# Altium schematic sheet 03_ESP32_CORE.SchDoc
size A3
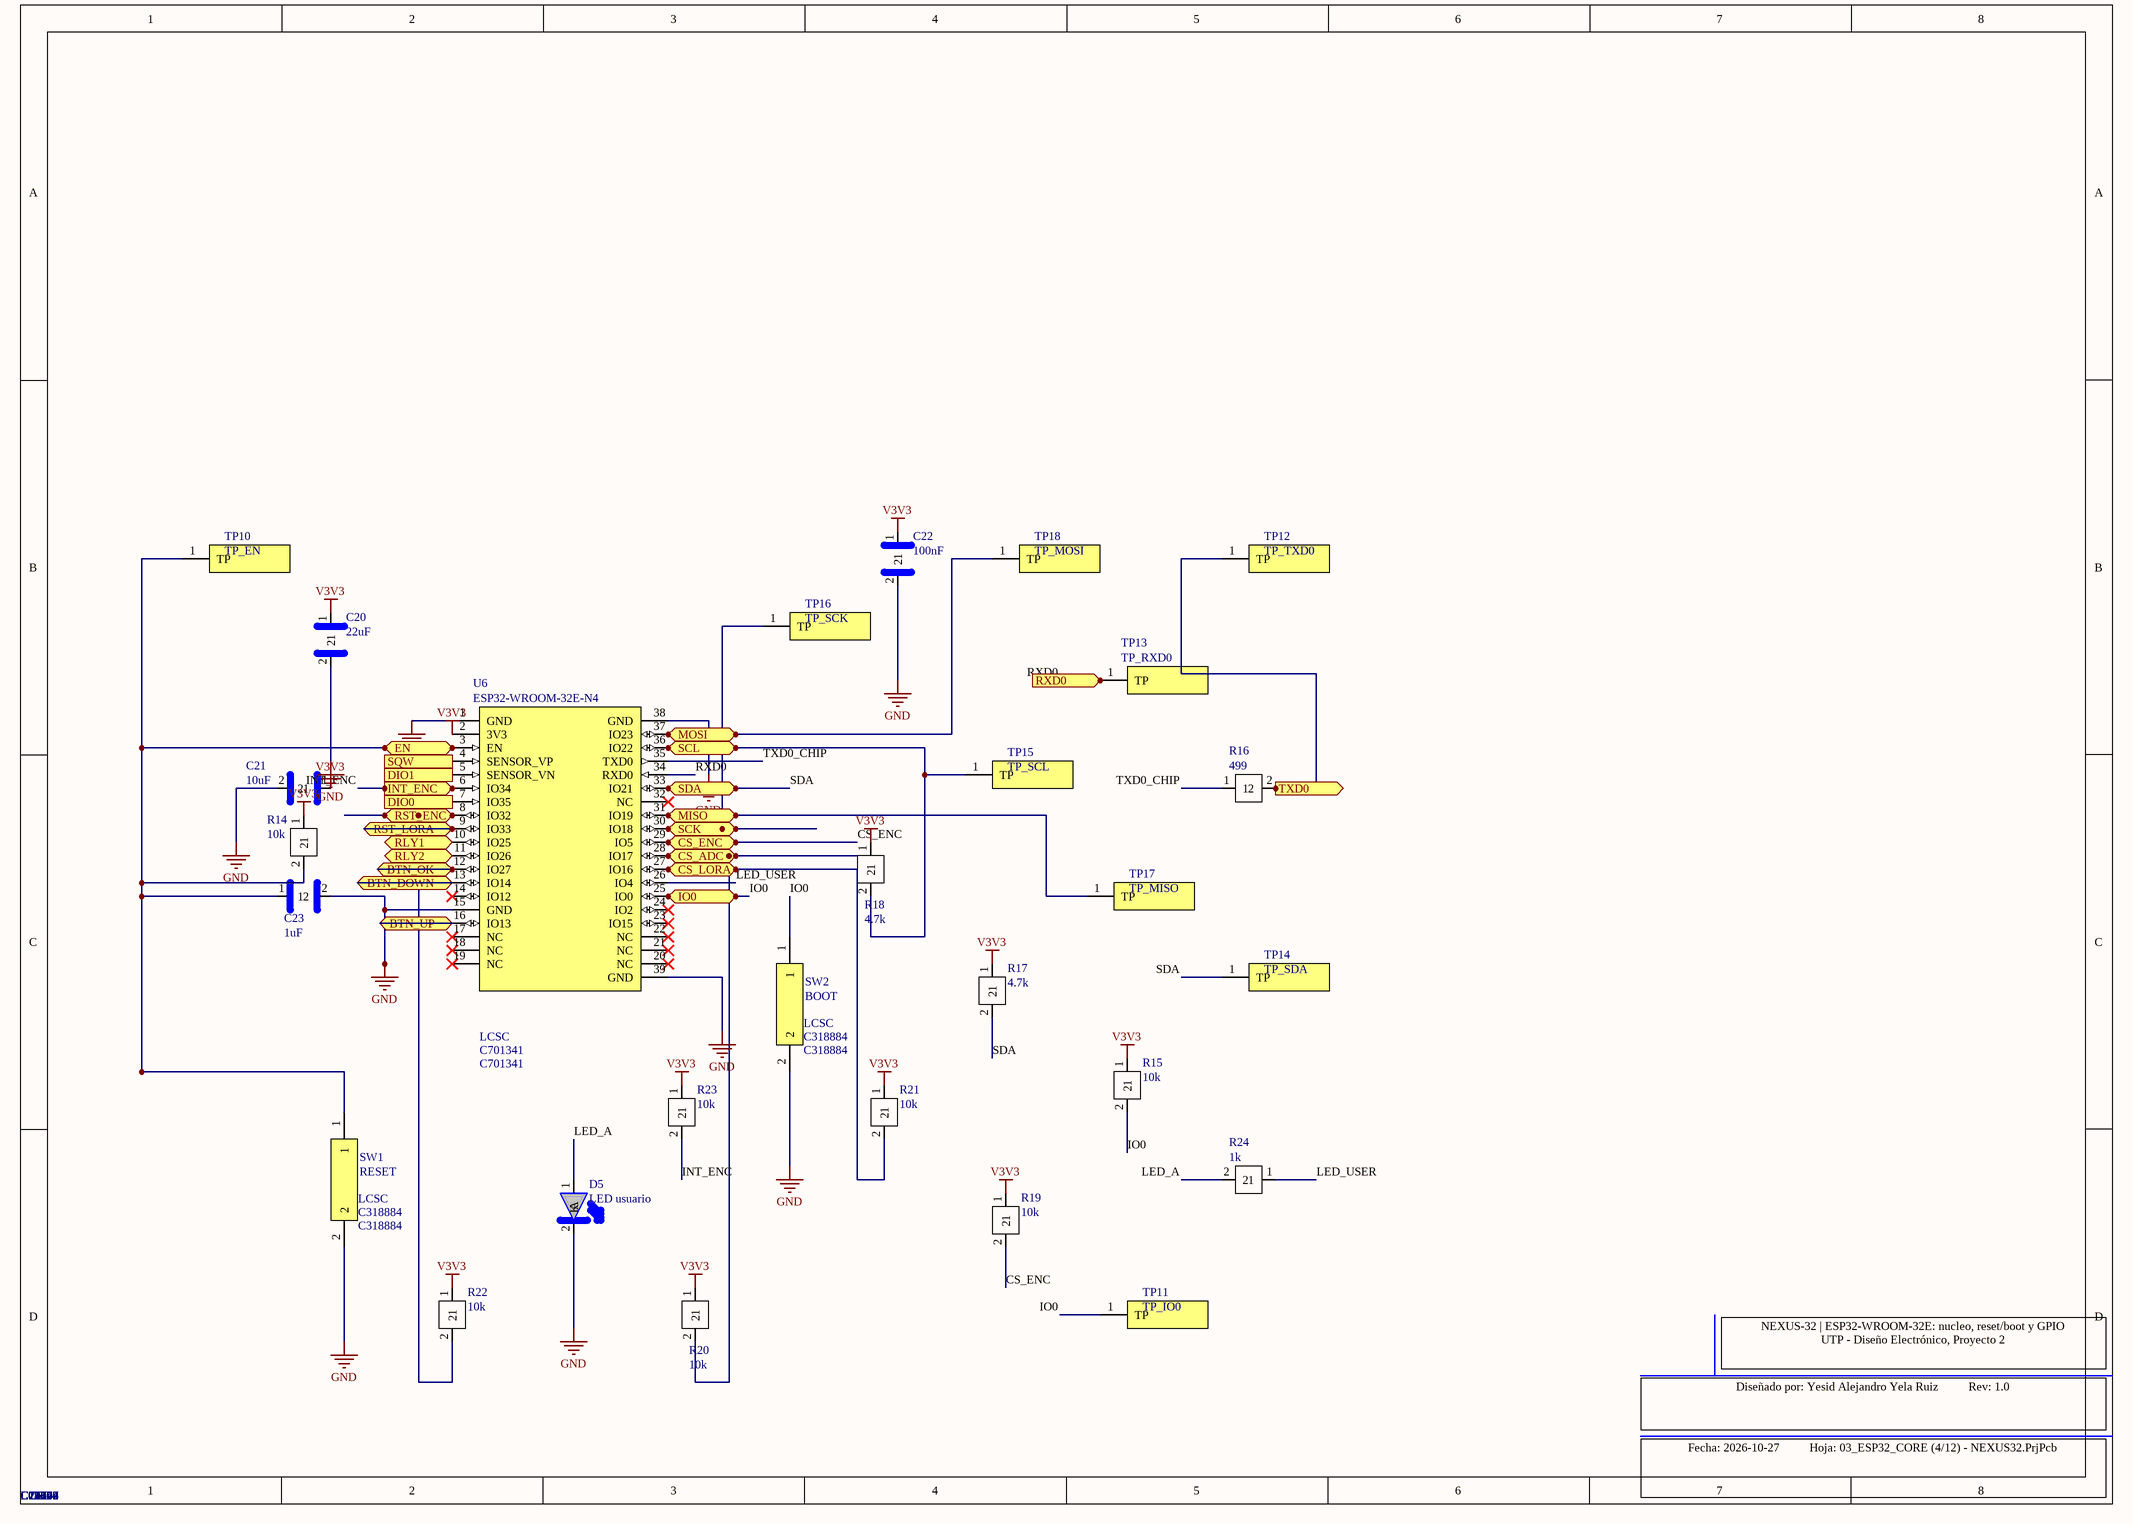
[diagram p0: 03_ESP32_CORE.SchDoc]

## Parts
C20  22uF  Supplier 1: LCSC  Supplier Part Number 1: C29277  [C_0805]
C21  10uF  Supplier 1: LCSC  Supplier Part Number 1: C19702  [R_0603]
C22  100nF  Supplier 1: LCSC  Supplier Part Number 1: C14663  [R_0603]
C23  1uF  Supplier 1: LCSC  Supplier Part Number 1: C15849  [R_0603]
D5  LED usuario  Supplier 1: LCSC  Supplier Part Number 1: C2286  [LED_0603]
R14  10k  Supplier 1: LCSC  Supplier Part Number 1: C25804  [R_0603]
R15  10k  Supplier 1: LCSC  Supplier Part Number 1: C25804  [R_0603]
R16  499  Supplier 1: LCSC  Supplier Part Number 1: C23065  [R_0603]
R17  4.7k  Supplier 1: LCSC  Supplier Part Number 1: C23162  [R_0603]
R18  4.7k  Supplier 1: LCSC  Supplier Part Number 1: C23162  [R_0603]
R19  10k  Supplier 1: LCSC  Supplier Part Number 1: C25804  [R_0603]
R20  10k  Supplier 1: LCSC  Supplier Part Number 1: C25804  [R_0603]
R21  10k  Supplier 1: LCSC  Supplier Part Number 1: C25804  [R_0603]
R22  10k  Supplier 1: LCSC  Supplier Part Number 1: C25804  [R_0603]
R23  10k  Supplier 1: LCSC  Supplier Part Number 1: C25804  [R_0603]
R24  1k  Supplier 1: LCSC  Supplier Part Number 1: C21190  [R_0603]
SW1  RESET  Supplier 1: LCSC  Supplier Part Number 1: C318884  [SW_TS-1187A]
SW2  BOOT  Supplier 1: LCSC  Supplier Part Number 1: C318884  [SW_TS-1187A]
TP10  TP_EN  [TP_PAD_1.5mm]
TP11  TP_IO0  [TP_PAD_1.5mm]
TP12  TP_TXD0  [TP_PAD_1.5mm]
TP13  TP_RXD0  [TP_PAD_1.5mm]
TP14  TP_SDA  [TP_PAD_1.5mm]
TP15  TP_SCL  [TP_PAD_1.5mm]
TP16  TP_SCK  [TP_PAD_1.5mm]
TP17  TP_MISO  [TP_PAD_1.5mm]
TP18  TP_MOSI  [TP_PAD_1.5mm]
U6  ESP32-WROOM-32E-N4  Supplier 1: LCSC  Supplier Part Number 1: C701341  [ESP32-WROOM-32E]

## Ports
BTN_DOWN (bidir), BTN_OK (bidir), BTN_UP (bidir), CS_ADC (bidir), CS_ENC (bidir), CS_LORA (bidir), DIO0 (in), DIO1 (in), EN (bidir), INT_ENC (in), IO0 (bidir), MISO (bidir), MOSI (bidir), RLY1 (bidir), RLY2 (bidir), RST_ENC (bidir), RST_LORA (bidir), RXD0 (in), SCK (bidir), SCL (bidir), SDA (bidir), SQW (in), TXD0 (out)

## Nets
GND: C20.2 C21.2 C22.2 C23.2 D5.2(K) SW1.2 SW2.2 U6.1(GND) U6.15(GND) U6.38(GND) U6.39(GND)
V3V3: C20.1 C21.1 C22.1 R14.1 R15.1 R17.1 R18.1 R19.1 R20.1 R21.1 R22.1 R23.1 U6.2(3V3)
BTN_DOWN: U6.13(IO14) ; port BTN_DOWN
BTN_OK: U6.12(IO27) ; port BTN_OK
BTN_UP: U6.16(IO13) ; port BTN_UP
CS_ADC: R20.2 U6.28(IO17) ; port CS_ADC
CS_ENC: R19.2 U6.29(IO5) ; port CS_ENC
CS_LORA: R21.2 U6.27(IO16) ; port CS_LORA
DIO0: U6.7(IO35) ; port DIO0
DIO1: U6.5(SENSOR_VN) ; port DIO1
EN: C23.1 R14.2 SW1.1 TP10.1(TP) U6.3(EN) ; port EN
INT_ENC: R23.2 U6.6(IO34) ; port INT_ENC
IO0: R15.2 SW2.1 TP11.1(TP) U6.25(IO0) ; port IO0
LED_A: D5.1(A) R24.2
LED_USER: R24.1 U6.26(IO4)
MISO: TP17.1(TP) U6.31(IO19) ; port MISO
MOSI: TP18.1(TP) U6.37(IO23) ; port MOSI
RLY1: U6.10(IO25) ; port RLY1
RLY2: U6.11(IO26) ; port RLY2
RST_ENC: R22.2 U6.8(IO32) ; port RST_ENC
RST_LORA: U6.9(IO33) ; port RST_LORA
RXD0: TP13.1(TP) U6.34(RXD0) ; port RXD0
SCK: TP16.1(TP) U6.30(IO18) ; port SCK
SCL: R18.2 TP15.1(TP) U6.36(IO22) ; port SCL
SDA: R17.2 TP14.1(TP) U6.33(IO21) ; port SDA
SQW: U6.4(SENSOR_VP) ; port SQW
TXD0: R16.2 TP12.1(TP) ; port TXD0
TXD0_CHIP: R16.1 U6.35(TXD0)

Not connected (* = marked no-connect by the designer): U6 14(IO12)* 17(NC)* 18(NC)* 19(NC)* 20(NC)* 21(NC)* 22(NC)* 23(IO15)* 24(IO2)* 32(NC)*

## Notes on the sheet
- NEXUS-32 | ESP32-WROOM-32E: nucleo, reset/boot y GPIO
  UTP - Diseño Electrónico, Proyecto 2
- Diseñado por: Yesid Alejandro Yela Ruiz          Rev: 1.0
- Fecha: 2026-10-27          Hoja: 03_ESP32_CORE (4/12) - NEXUS32.PrjPcb

## Library data of the parts
C20 = CAP_0805: Condensador ceramico SMD 0805; Manufacturer: Samsung; Manufacturer Part Number: CL21A226MPQNNNE; Datasheet: https://wmsc.lcsc.com/wmsc/upload/file/pdf/v2/lcsc/2206010045_UNI-ROYAL-Uniroyal-Elec-0603WAF1002T5E_C25804.pdf; LCSC Part #: C29277
C21 = CAP_0603: Condensador ceramico SMD 0603; Manufacturer: Samsung; Manufacturer Part Number: CL10A106KP8NNNC; Datasheet: https://wmsc.lcsc.com/wmsc/upload/file/pdf/v2/lcsc/2206010045_UNI-ROYAL-Uniroyal-Elec-0603WAF1002T5E_C25804.pdf; LCSC Part #: C19702
C22 = CAP_0603: Condensador ceramico SMD 0603; Manufacturer: YAGEO; Manufacturer Part Number: CC0603KRX7R9BB104; Datasheet: https://wmsc.lcsc.com/wmsc/upload/file/pdf/v2/lcsc/2206010045_UNI-ROYAL-Uniroyal-Elec-0603WAF1002T5E_C25804.pdf; LCSC Part #: C14663
C23 = CAP_0603: Condensador ceramico SMD 0603; Manufacturer: Samsung; Manufacturer Part Number: CL10A105KB8NNNC; Datasheet: https://wmsc.lcsc.com/wmsc/upload/file/pdf/v2/lcsc/2206010045_UNI-ROYAL-Uniroyal-Elec-0603WAF1002T5E_C25804.pdf; LCSC Part #: C15849
D5 = LED_0603: LED SMD 0603; Manufacturer: Hubei KENTO; Manufacturer Part Number: KT-0603R; Datasheet: https://wmsc.lcsc.com/wmsc/upload/file/pdf/v2/lcsc/2206010045_UNI-ROYAL-Uniroyal-Elec-0603WAF1002T5E_C25804.pdf; LCSC Part #: C2286
R14 R15 R19-R23 = RES_0603: Resistencia SMD 0603; Manufacturer: UNI-ROYAL; Manufacturer Part Number: 0603WAF1002T5E; Datasheet: https://wmsc.lcsc.com/wmsc/upload/file/pdf/v2/lcsc/2206010045_UNI-ROYAL-Uniroyal-Elec-0603WAF1002T5E_C25804.pdf; LCSC Part #: C25804
R16 = RES_0603: Resistencia SMD 0603; Manufacturer: UNI-ROYAL; Manufacturer Part Number: 0603WAF4990T5E; Datasheet: https://wmsc.lcsc.com/wmsc/upload/file/pdf/v2/lcsc/2206010045_UNI-ROYAL-Uniroyal-Elec-0603WAF1002T5E_C25804.pdf; LCSC Part #: C23065
R17 R18 = RES_0603: Resistencia SMD 0603; Manufacturer: UNI-ROYAL; Manufacturer Part Number: 0603WAF4701T5E; Datasheet: https://wmsc.lcsc.com/wmsc/upload/file/pdf/v2/lcsc/2206010045_UNI-ROYAL-Uniroyal-Elec-0603WAF1002T5E_C25804.pdf; LCSC Part #: C23162
R24 = RES_0603: Resistencia SMD 0603; Manufacturer: UNI-ROYAL; Manufacturer Part Number: 0603WAF1001T5E; Datasheet: https://wmsc.lcsc.com/wmsc/upload/file/pdf/v2/lcsc/2206010045_UNI-ROYAL-Uniroyal-Elec-0603WAF1002T5E_C25804.pdf; LCSC Part #: C21190
SW1 SW2 = TS-1187A-B-A-B: Pulsador tactil SMD 5.1x5.1 (XKB TS-1187A-B-A-B); pads A-B unidos (1) y C-D unidos (2); Manufacturer: XKB Connection; Manufacturer Part Number: TS-1187A-B-A-B; LCSC Part #: C318884; Datasheet: https://wmsc.lcsc.com/wmsc/upload/file/pdf/v2/lcsc/2304140030_XKB-Connection-TS-1187A-B-A-B_C318884.pdf
TP10-TP18 = TESTPOINT: Punto de prueba, pad desnudo de 1.5mm sin montaje; Manufacturer: n/a; Manufacturer Part Number: TP_PAD_1.5mm; Datasheet: https://wmsc.lcsc.com/wmsc/upload/file/pdf/v2/lcsc/2206010045_UNI-ROYAL-Uniroyal-Elec-0603WAF1002T5E_C25804.pdf
U6 = ESP32-WROOM-32E-N4: Modulo WiFi/BT ESP32-WROOM-32E-N4 (Espressif), 38 pines + pad GND; Manufacturer: Espressif Systems; Manufacturer Part Number: ESP32-WROOM-32E-N4; LCSC Part #: C701341; Datasheet: https://www.espressif.com/sites/default/files/documentation/esp32-wroom-32e_esp32-wroom-32ue_datasheet_en.pdf